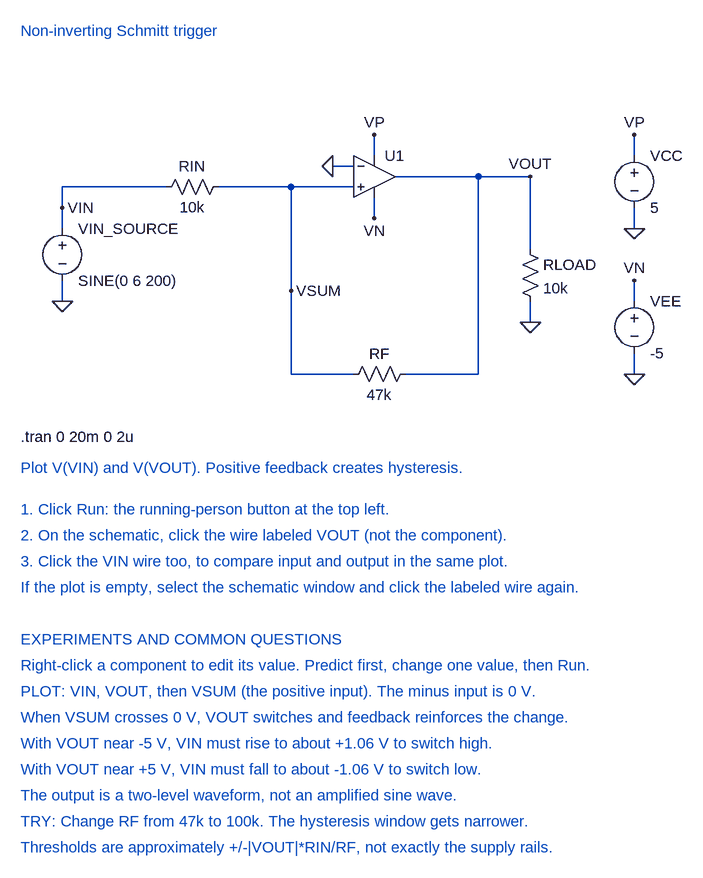
[diagram p0: schematic 08-non-inverting-schmitt-trigger.asc]
08-non-inverting-schmitt-trigger.asc, the LTspice schematic file:
Version 4
SHEET 1 1200 1400
WIRE 608 224 608 192
WIRE 608 288 608 320
WIRE 128 304 128 336
WIRE 128 416 128 448
WIRE 128 304 128 272
WIRE 128 272 288 272
WIRE 368 272 576 272
WIRE 640 256 848 256
WIRE 848 256 848 368
WIRE 848 448 848 480
WIRE 480 272 480 560
WIRE 480 560 576 560
WIRE 656 560 768 560
WIRE 768 560 768 256
WIRE 544 240 576 240
WIRE 1008 192 1008 224
WIRE 1008 304 1008 336
WIRE 1008 416 1008 448
WIRE 1008 528 1008 560
FLAG 608 192 VP
FLAG 608 320 VN
FLAG 128 304 VIN
FLAG 128 448 0
FLAG 848 256 VOUT
FLAG 848 480 0
FLAG 480 432 VSUM
FLAG 544 240 0
FLAG 1008 192 VP
FLAG 1008 336 0
FLAG 1008 416 VN
FLAG 1008 560 0
SYMBOL Opamps\UniversalOpamp2 608 256 R0
SYMATTR InstName U1
SYMBOL voltage 128 320 R0
SYMATTR InstName VIN_SOURCE
SYMATTR Value SINE(0 6 200)
SYMBOL res 384 256 R90
WINDOW 0 0 56 VBottom 2
WINDOW 3 32 56 VTop 2
SYMATTR InstName RIN
SYMATTR Value 10k
SYMBOL res 832 352 R0
SYMATTR InstName RLOAD
SYMATTR Value 10k
SYMBOL res 672 544 R90
WINDOW 0 0 56 VBottom 2
WINDOW 3 32 56 VTop 2
SYMATTR InstName RF
SYMATTR Value 47k
SYMBOL voltage 1008 208 R0
SYMATTR InstName VCC
SYMATTR Value 5
SYMBOL voltage 1008 432 R0
SYMATTR InstName VEE
SYMATTR Value -5
TEXT 64 32 Left 2 ;Non-inverting Schmitt trigger
TEXT 64 656 Left 2 !.tran 0 20m 0 2u
TEXT 64 704 Left 2 ;Plot V(VIN) and V(VOUT). Positive feedback creates hysteresis.
TEXT 64 768 Left 2 ;1. Click Run: the running-person button at the top left.
TEXT 64 808 Left 2 ;2. On the schematic, click the wire labeled VOUT (not the component).
TEXT 64 848 Left 2 ;3. Click the VIN wire too, to compare input and output in the same plot.
TEXT 64 888 Left 2 ;If the plot is empty, select the schematic window and click the labeled wire again.
TEXT 64 968 Left 2 ;EXPERIMENTS AND COMMON QUESTIONS
TEXT 64 1008 Left 2 ;Right-click a component to edit its value. Predict first, change one value, then Run.
TEXT 64 1048 Left 2 ;PLOT: VIN, VOUT, then VSUM (the positive input). The minus input is 0 V.
TEXT 64 1088 Left 2 ;When VSUM crosses 0 V, VOUT switches and feedback reinforces the change.
TEXT 64 1128 Left 2 ;With VOUT near -5 V, VIN must rise to about +1.06 V to switch high.
TEXT 64 1168 Left 2 ;With VOUT near +5 V, VIN must fall to about -1.06 V to switch low.
TEXT 64 1208 Left 2 ;The output is a two-level waveform, not an amplified sine wave.
TEXT 64 1248 Left 2 ;TRY: Change RF from 47k to 100k. The hysteresis window gets narrower.
TEXT 64 1288 Left 2 ;Thresholds are approximately +/-|VOUT|*RIN/RF, not exactly the supply rails.

The netlist it stands for:
* 08-non-inverting-schmitt-trigger.asc
XU1 VSUM 0 VP VN VOUT level.2 Avol=1Meg GBW=10Meg Slew=10Meg ilimit=25m rail=0 Vos=0 phimargin=45 en=0 enk=0 in=0 ink=0 Rin=500Meg  ; pins IN+ IN- V+ V- OUT
VIN_SOURCE VIN 0 SINE(0 6 200)
RIN VSUM VIN 10k
RLOAD VOUT 0 10k
RF VOUT VSUM 47k
VCC VP 0 5
VEE VN 0 -5
* Non-inverting Schmitt trigger
.tran 0 20m 0 2u
* Plot V(VIN) and V(VOUT). Positive feedback creates hysteresis.
* 1. Click Run: the running-person button at the top left.
* 2. On the schematic, click the wire labeled VOUT (not the component).
* 3. Click the VIN wire too, to compare input and output in the same plot.
* If the plot is empty, select the schematic window and click the labeled wire again.
* EXPERIMENTS AND COMMON QUESTIONS
* Right-click a component to edit its value. Predict first, change one value, then Run.
* PLOT: VIN, VOUT, then VSUM (the positive input). The minus input is 0 V.
* When VSUM crosses 0 V, VOUT switches and feedback reinforces the change.
* With VOUT near -5 V, VIN must rise to about +1.06 V to switch high.
* With VOUT near +5 V, VIN must fall to about -1.06 V to switch low.
* The output is a two-level waveform, not an amplified sine wave.
* TRY: Change RF from 47k to 100k. The hysteresis window gets narrower.
* Thresholds are approximately +/-|VOUT|*RIN/RF, not exactly the supply rails.
.lib UniversalOpamps2.sub
.backanno
.end